# Altium schematic sheet MIPI_General_IO.SchDoc
size A4; SheetNumber: 2; SheetTotal: 13
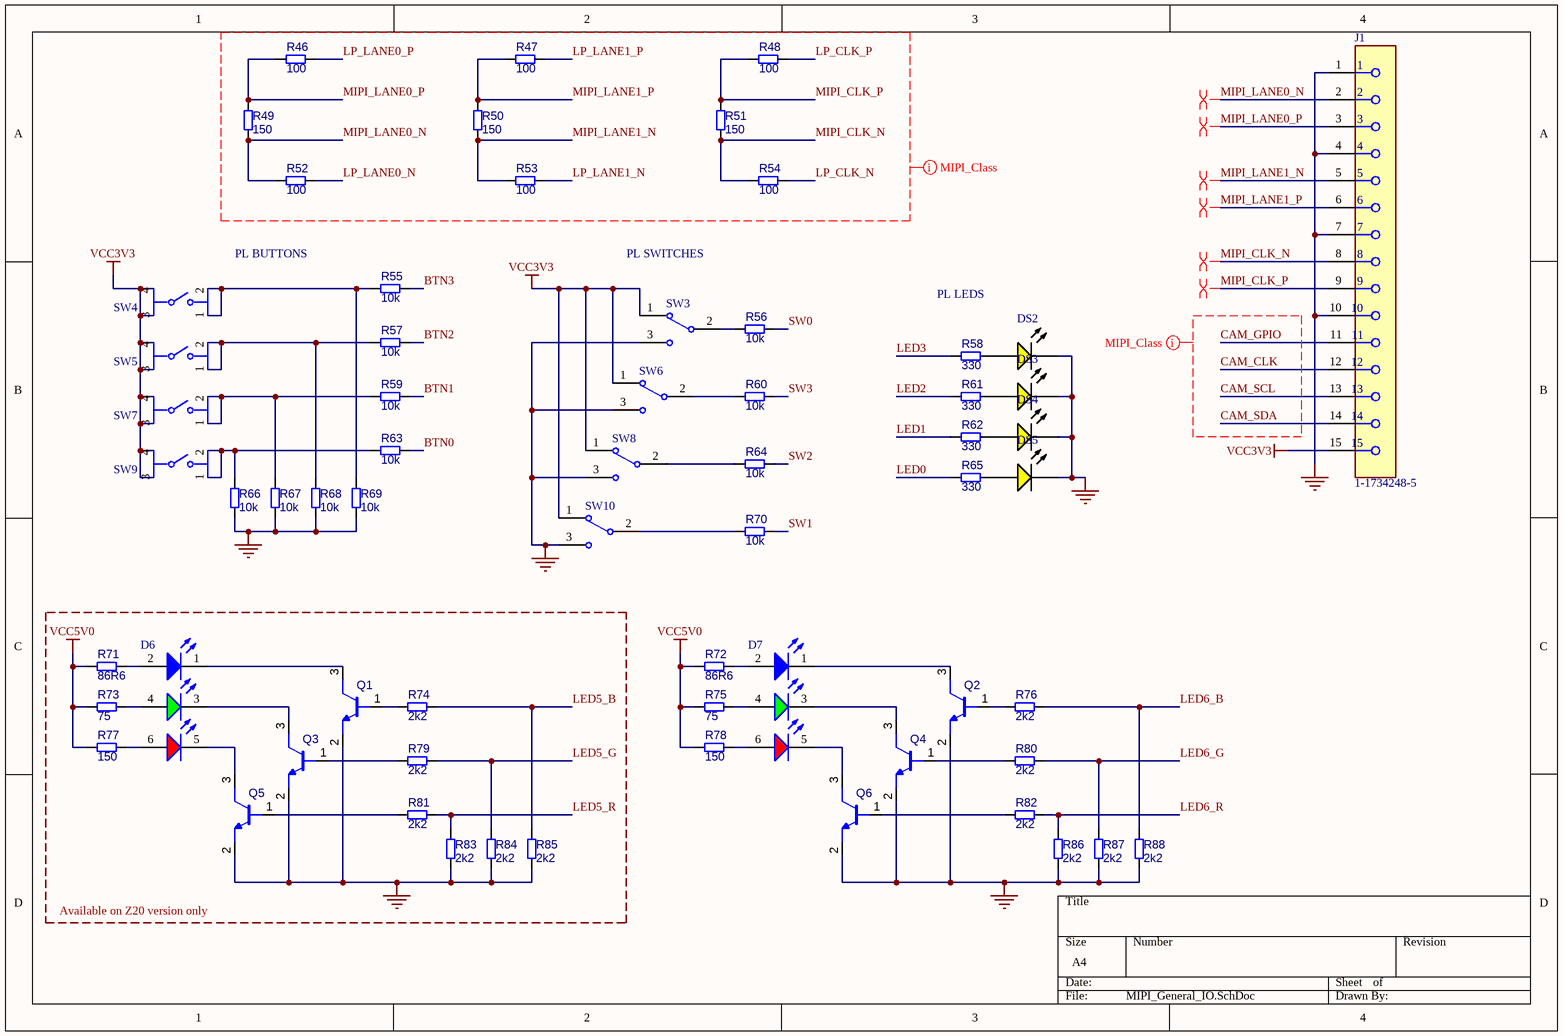
[diagram p0: MIPI_General_IO.SchDoc]

## Parts
D6  150352M173303  [WL-SFTW_3528_150352M173303]  (value not drawn)
D7  150352M173303  [WL-SFTW_3528_150352M173303]  (value not drawn)
DS2  19-217/Y5C-AM1N1VY/3T  [EVRL-0603-2_V]  (value not drawn)
DS3  19-217/Y5C-AM1N1VY/3T  [EVRL-0603-2_V]  (value not drawn)
DS4  19-217/Y5C-AM1N1VY/3T  [EVRL-0603-2_V]  (value not drawn)
DS5  19-217/Y5C-AM1N1VY/3T  [EVRL-0603-2_V]  (value not drawn)
J1  1-1734248-5  [FP-1-1734248-5-MFG]
Q1  MMBT2222AM3T5G  [ROHM-SOT723-3_V]  (value not drawn)
Q2  MMBT2222AM3T5G  [ROHM-SOT723-3_V]  (value not drawn)
Q3  MMBT2222AM3T5G  [ROHM-SOT723-3_V]  (value not drawn)
Q4  MMBT2222AM3T5G  [ROHM-SOT723-3_V]  (value not drawn)
Q5  MMBT2222AM3T5G  [ROHM-SOT723-3_V]  (value not drawn)
Q6  MMBT2222AM3T5G  [ROHM-SOT723-3_V]  (value not drawn)
R46  100  [R_0402]
R47  100  [R_0402]
R48  100  [R_0402]
R49  150  [R_0402]
R50  150  [R_0402]
R51  150  [R_0402]
R52  100  [R_0402]
R53  100  [R_0402]
R54  100  [R_0402]
R55  10k  [R_0402]
R56  10k  [R_0402]
R57  10k  [R_0402]
R58  330  [R_0402]
R59  10k  [R_0402]
R60  10k  [R_0402]
R61  330  [R_0402]
R62  330  [R_0402]
R63  10k  [R_0402]
R64  10k  [R_0402]
R65  330  [R_0402]
R66  10k  [R_0402]
R67  10k  [R_0402]
R68  10k  [R_0402]
R69  10k  [R_0402]
R70  10k  [R_0402]
R71  86R6  [R_0402]
R72  86R6  [R_0402]
R73  75  [R_0402]
R74  2k2  [R_0402]
R75  75  [R_0402]
R76  2k2  [R_0402]
R77  150  [R_0402]
R78  150  [R_0402]
R79  2k2  [R_0402]
R80  2k2  [R_0402]
R81  2k2  [R_0402]
R82  2k2  [R_0402]
R83  2k2  [R_0402]
R84  2k2  [R_0402]
R85  2k2  [R_0402]
R86  2k2  [R_0402]
R87  2k2  [R_0402]
R88  2k2  [R_0402]
SW3  EG1218  [ESWI-EG1218_V]  (value not drawn)
SW4  1301.9316.24  [FP-1301_9316_24-MFG]  (value not drawn)
SW5  1301.9316.24  [FP-1301_9316_24-MFG]  (value not drawn)
SW6  EG1218  [ESWI-EG1218_V]  (value not drawn)
SW7  1301.9316.24  [FP-1301_9316_24-MFG]  (value not drawn)
SW8  EG1218  [ESWI-EG1218_V]  (value not drawn)
SW9  1301.9316.24  [FP-1301_9316_24-MFG]  (value not drawn)
SW10  EG1218  [ESWI-EG1218_V]  (value not drawn)

## Blocks framed on the sheet
Available on Z20 version only: D6 Q1 Q3 Q5 R71 R73 R74 R77 R79 R81 R83-R85

## Nets
GND: DS2.2(K) DS3.2(K) DS4.2(K) DS5.2(K) J1.1 J1.4 J1.7 J1.10 Q1.2(E) Q2.2(E) Q3.2(E) Q4.2(E) Q5.2(E) Q6.2(E) R66.2 R67.2 R68.2 R69.2 R83.1 R84.1 R85.1 R86.1 R87.1 R88.1 SW3.3 SW6.3 SW8.3 SW10.3
VCC3V3: J1.15 SW3.1 SW4.3 SW4.4 SW5.3 SW5.4 SW6.1 SW7.3 SW7.4 SW8.1 SW9.3 SW9.4 SW10.1
VCC5V0: R71.1 R72.1 R73.1 R75.1 R77.1 R78.1
BTN0: R63.1
BTN1: R59.1
BTN2: R57.1
BTN3: R55.1
CAM_CLK: J1.12
CAM_GPIO: J1.11
CAM_SCL: J1.13
CAM_SDA: J1.14
LED0: R65.2
LED1: R62.2
LED2: R61.2
LED3: R58.2
LED5_B: R74.2 R85.2
LED5_G: R79.2 R84.2
LED5_R: R81.2 R83.2
LED6_B: R76.2 R88.2
LED6_G: R80.2 R87.2
LED6_R: R82.2 R86.2
LP_CLK_N: R54.1
LP_CLK_P: R48.1
LP_LANE0_N: R52.1
LP_LANE0_P: R46.1
LP_LANE1_N: R53.1
LP_LANE1_P: R47.1
MIPI_CLK_N: J1.8 R51.2 R54.2
MIPI_CLK_P: J1.9 R48.2 R51.1
MIPI_LANE0_N: J1.2 R49.2 R52.2
MIPI_LANE0_P: J1.3 R46.2 R49.1
MIPI_LANE1_N: J1.5 R50.2 R53.2
MIPI_LANE1_P: J1.6 R47.2 R50.1
SW0: R56.1
SW1: R70.1
SW2: R64.1
SW3: R60.1
NetD6_1: D6.1(K) Q1.3(C)
NetD6_2: D6.2(A) R71.2
NetD6_3: D6.3(K) Q3.3(C)
NetD6_4: D6.4(A) R73.2
NetD6_5: D6.5(K) Q5.3(C)
NetD6_6: D6.6(A) R77.2
NetD7_1: D7.1(K) Q2.3(C)
NetD7_2: D7.2(A) R72.2
NetD7_3: D7.3(K) Q4.3(C)
NetD7_4: D7.4(A) R75.2
NetD7_5: D7.5(K) Q6.3(C)
NetD7_6: D7.6(A) R78.2
NetDS2_1: DS2.1(A) R58.1
NetDS3_1: DS3.1(A) R61.1
NetDS4_1: DS4.1(A) R62.1
NetDS5_1: DS5.1(A) R65.1
NetQ1_1: Q1.1(B) R74.1
NetQ2_1: Q2.1(B) R76.1
NetQ3_1: Q3.1(B) R79.1
NetQ4_1: Q4.1(B) R80.1
NetQ5_1: Q5.1(B) R81.1
NetQ6_1: Q6.1(B) R82.1
NetR55_2: R55.2 R69.1 SW4.1 SW4.2
NetR56_2: R56.2 SW3.2(COM)
NetR57_2: R57.2 R68.1 SW5.1 SW5.2
NetR59_2: R59.2 R67.1 SW7.1 SW7.2
NetR60_2: R60.2 SW6.2(COM)
NetR63_2: R63.2 R66.1 SW9.1 SW9.2
NetR64_2: R64.2 SW8.2(COM)
NetR70_2: R70.2 SW10.2(COM)

## Layout directives
differential pair: MIPI_CLK_N, MIPI_CLK_P, MIPI_LANE0_N, MIPI_LANE0_P, MIPI_LANE1_N, MIPI_LANE1_P
net class MIPI_Class: CAM_CLK, CAM_GPIO, CAM_SCL, CAM_SDA, LP_CLK_N, LP_CLK_P, LP_LANE0_N, LP_LANE0_P, LP_LANE1_N, LP_LANE1_P, MIPI_CLK_N, MIPI_CLK_P, MIPI_LANE0_N, MIPI_LANE0_P, MIPI_LANE1_N, MIPI_LANE1_P

## Notes on the sheet
- PL BUTTONS
- PL SWITCHES
- PL LEDS

## Library data of the parts
D6 D7 = CMP-03913-162511587-1: Led, Rgb, 625/520/470Nm, 120Deg Rohs Compliant: Yes; Manufacturer Lifecycle Status: NEW; Luminous Intensity: 500mcd; Peak Wavelength: 465nm; YEOL: 1 = Estimated lifetime > 10 years; Dominant Wavelength: 520nm; Forward Voltage: 2V; Forward Current: 100mA; Viewing Angle: 120°; Max Reverse Voltage (DC): 5V; Power Dissipation: 65mW; Lifecycle Status: New; Max Operating Temperature: 105°C; Min Operating Temperature: -40°C; RoHS: Compliant
DS2-DS5 = CMP-007-00005-2: Chip LED, Yellow, 5 V, 25mA, -40 to 85 degC, 2-Pin SMD (0603), RoHS, Tape and Reel; Manufacturer: Everlight Electronics; Datasheet Version: Rev. 1.0, 12/2005; Package Reference: 0603; Mounting Technology: SM; Package Description: 2-Pin Surface Mount Device, Body 1.6 x 0.8 mm; Case/Package: 0603; Datasheet URL: http://www.fairchip.com/pdf/Everlight/19-217-Y5C-AM1N1VY-3T.pdf; Manufacturer URL: http://www.everlight.com/; RoHS Compliant: False
J1 = CMP-03368-000001-1: CONN FPC VERT 15POS 1.00MM SMD; Manufacturer: TE; Conn Orientation: Vertical; Conn Gender: Female; Current Rating: 1A; Is Female: yes; Number Of Contacts: 15; Pitch: 1mm; Voltage Rating: 125V; ComponentLink2URL: https://www.te.com/commerce/DocumentDelivery/DDEController?Action=showdoc&DocId=Customer+Drawing%7F1734248%7FE1%7Fpdf%7FEnglish%7FENG_CD_1734248_E1__.pdf%7F1-1734248-5; Device Class L1: Connectors; Category: Conn; Package: 0; Lead Free: Yes; Digikey Description: CONN FPC VERT 15POS 1.00MM SMD; Height: 8mm; Manufacturer Part Number: 1-1734248-5; Temperature: -20°C to +85°C; Contact Material: Gold,Nickel; Device Class L3: unset; ComponentLink2Description: Datasheet; RoHS: TRUE; Temperature Range Low: -20°C; Octopart: https://octopart.com/1-1734248-5-te+connectivity-40620898; Device Class L2: FFC / FPC; Mouser Description: FFC & FPC Connectors 15P 1.0 FPC, Zip V/T SMT; Automotive: No; Temperature Range High: +85°C; Mounting Type: Surface Mount
Q1-Q6 = CMP-013-00028-2: NPN General Purpose Transistor, 3-Pin SOT-723, Pb-Free, Tape and Reel; ComponentLink3Description: Package Specification; ComponentLink1URL: http://www.onsemi.com/; ComponentLink3URL: http://www.onsemi.com/pub_link/Collateral/631AA.PDF; ComponentLink2Description: Datasheet; Mounting Technology: SMT; Pins: 3; Case/Package: SOT-723; RoHS Compliant: TRUE; ComponentLink1Description: Manufacturer URL; ComponentLink2URL: http://www.onsemi.cn/pub_link/Collateral/MMBT2222AM3-D.PDF
R46-R88 = CMP-009-00178-3: Chip 0402 resistor
SW3 SW6 SW8 SW10 = CMP-011-00006-2: Slide Switch, SPDT, 500 V, -20 to 70 degC, 3-Pin THD, RoHS, Bulk; Manufacturer: E-Switch; Voltage Rating (DC): 30V; Current Rating: 200mA; Operating Force: 250gf; Package Quantity: 1000; Contact Plating: Silver; Max Operating Temperature: 70°C; Min Operating Temperature: -20°C; Contact Material: Copper; Datasheet URL: https://www.e-switch.com/system/asset/product_line/data_sheet/119/EG.pdf; Contact Finish: Silver; Case/Package: EG1218; Voltage Rating (AC): 30V; Datasheet Version: Oct-15; Package Description: 3-Pin Through Hole Device, Body 11.6 x 4 mm, Pitch 2.5 mm; RoHS Compliant: True; Package Reference: EG1218; Manufacturer URL: http://www.e-switch.ch/en/; Throw Configuration: SPDT; Contact Current Rating: 200mA; Mounting Technology: TH; Packaging: Bulk; Pins: 3
SW4 SW5 SW7 SW9 = CMP-00030-00001-1: Switch Tactile N.O. SPST Round Button Gull Wing 0.05A 12VDC >100000Cycles 1.6N SMD T/R; Max Operating Temperature: 70°C; Case/Package: SMD/SMT; Mounting Technology: Surface Mount; Min Operating Temperature: -20°C